# Altium schematic sheet ADC_1_Section.SchDoc
size A4; DocumentNumber: 6; SheetNumber: 6; SheetTotal: 11
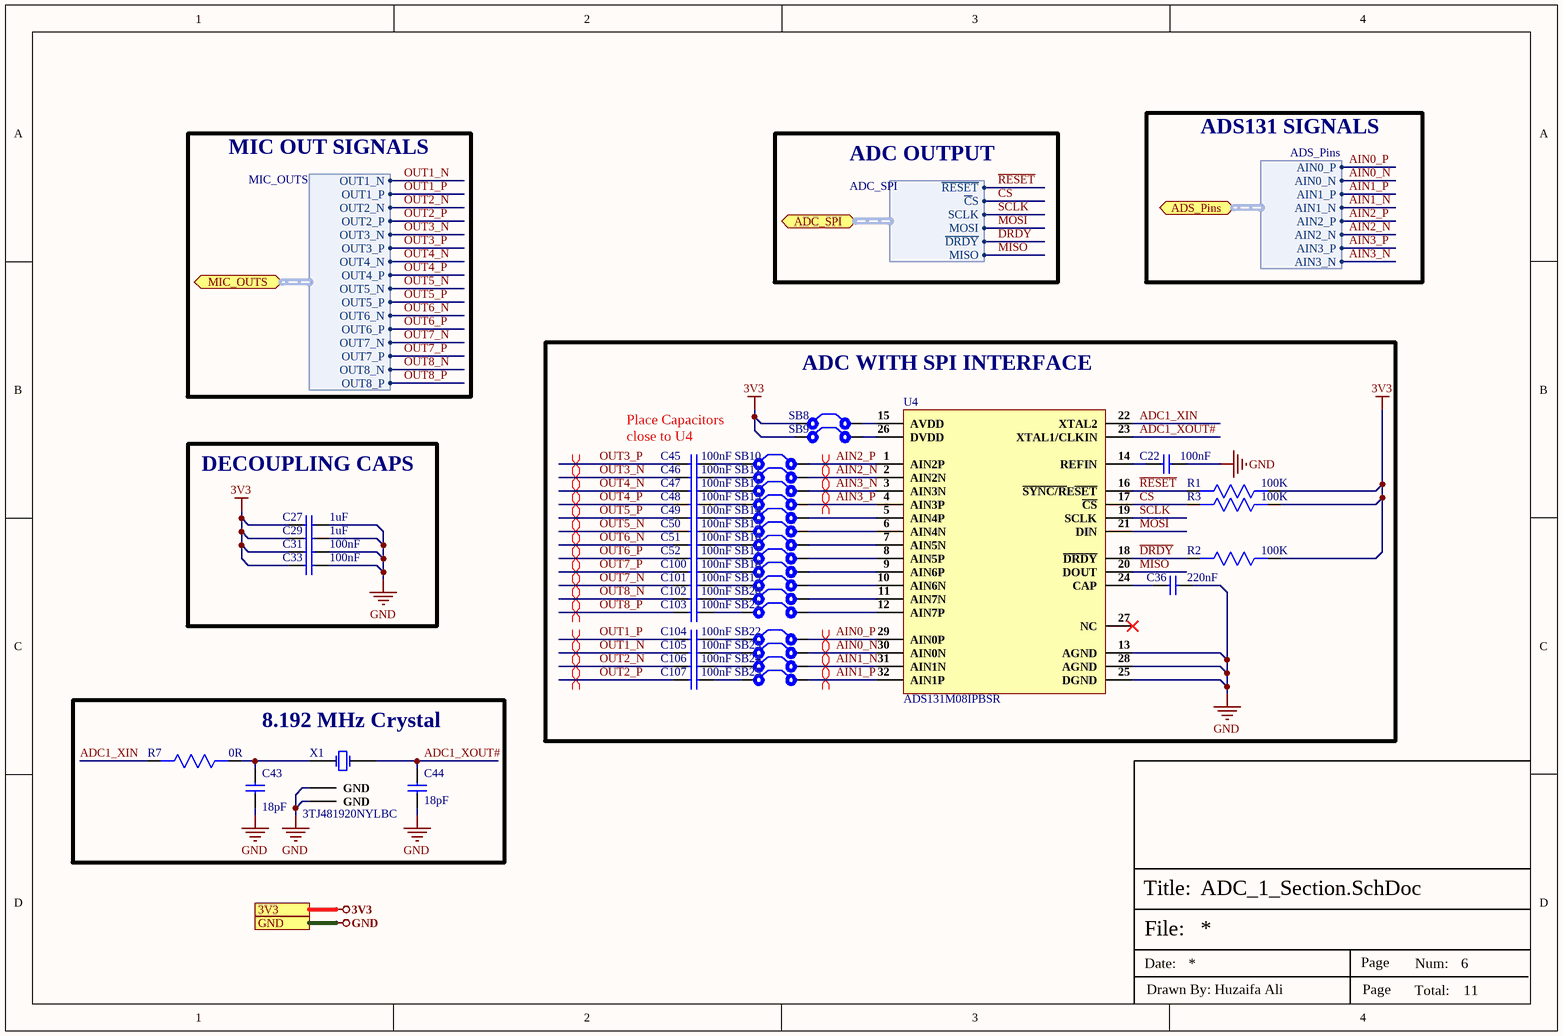
[diagram p0: ADC_1_Section.SchDoc]

## Parts
C22  100nF  [Cap-0603]
C27  1uF  [Cap-0402]
C29  1uF  [Cap-0402]
C31  100nF  [Cap-0603]
C33  100nF  [Cap-0603]
C36  220nF  [Cap 0603]
C43  18pF  [Cap 0603]
C44  18pF  [Cap 0603]
C45  100nF  [Cap-0402]
C46  100nF  [Cap-0402]
C47  100nF  [Cap-0402]
C48  100nF  [Cap-0402]
C49  100nF  [Cap-0402]
C50  100nF  [Cap-0402]
C51  100nF  [Cap-0402]
C52  100nF  [Cap-0402]
C100  100nF  [Cap-0402]
C101  100nF  [Cap-0402]
C102  100nF  [Cap-0402]
C103  100nF  [Cap-0402]
C104  100nF  [Cap-0402]
C105  100nF  [Cap-0402]
C106  100nF  [Cap-0402]
C107  100nF  [Cap-0402]
R1  100K  [Res0603]
R2  100K  [Res0603]
R3  100K  [Res0603]
R7  0R  [Res0603]
SB8  Solder Bridge  [Solder Bridge]  (value not drawn)
SB9  Solder Bridge  [Solder Bridge]  (value not drawn)
SB10  Solder Bridge  [Solder Bridge]  (value not drawn)
SB11  Solder Bridge  [Solder Bridge]  (value not drawn)
SB12  Solder Bridge  [Solder Bridge]  (value not drawn)
SB13  Solder Bridge  [Solder Bridge]  (value not drawn)
SB14  Solder Bridge  [Solder Bridge]  (value not drawn)
SB15  Solder Bridge  [Solder Bridge]  (value not drawn)
SB16  Solder Bridge  [Solder Bridge]  (value not drawn)
SB17  Solder Bridge  [Solder Bridge]  (value not drawn)
SB18  Solder Bridge  [Solder Bridge]  (value not drawn)
SB19  Solder Bridge  [Solder Bridge]  (value not drawn)
SB20  Solder Bridge  [Solder Bridge]  (value not drawn)
SB21  Solder Bridge  [Solder Bridge]  (value not drawn)
SB22  Solder Bridge  [Solder Bridge]  (value not drawn)
SB23  Solder Bridge  [Solder Bridge]  (value not drawn)
SB24  Solder Bridge  [Solder Bridge]  (value not drawn)
SB25  Solder Bridge  [Solder Bridge]  (value not drawn)
U4  ADS131M08IPBSR  [32TQFP]
X1  3TJ481920NYLBC  [3TJ481920NYLBC]

## Blocks framed on the sheet
ADC WITH SPI INTERFACE: C22 C36 C45-C52 C100-C107 R1-R3 SB8-SB25 U4
DECOUPLING CAPS: C27 C29 C31 C33
8.192 MHz Crystal: C43 C44 R7 X1

## Ports
3V3, ADC_SPI (bidir, harness ADC_SPI), ADS_Pins (bidir, harness ADS_Pins), GND, MIC_OUTS (bidir, harness MIC_OUTS)

## Harnesses
MIC_OUTS: OUT1_N, OUT1_P, OUT2_N, OUT2_P, OUT3_N, OUT3_P, OUT4_N, OUT4_P, OUT5_N, OUT5_P, OUT6_N, OUT6_P, OUT7_N, OUT7_P, OUT8_N, OUT8_P
ADC_SPI: ~{RESET}, ~{C}S, SCLK, MOSI, ~{DRDY}, MISO
ADS_Pins: AIN2_P, AIN2_N, AIN3_N, AIN3_P, AIN0_P, AIN0_N, AIN1_N, AIN1_P

## Nets
3V3: C27.1 C29.1 C31.1 C33.1 R1.1 R2.1 R3.1 SB8.1 SB9.1 ; port 3V3
GND: C22.2 C27.2 C29.2 C31.2 C33.2 C36.2 C43.1 C44.1 U4.13(AGND) U4.25(DGND) U4.28(AGND) X1.2(GND) X1.4(GND) ; port GND
~{C}S: R3.2 U4.17(~{CS}) ; port ADC_SPI.~{C}S
~{DRDY}: R2.2 U4.18(~{DRDY}) ; port ADC_SPI.~{DRDY}
~{RESET}: R1.2 U4.16(~{SYNC/R}E~{SET}) ; port ADC_SPI.~{RESET}
ADC1_XIN: R7.2 U4.22(XTAL2)
ADC1_XOUT#: C44.2 U4.23(XTAL1/CLKIN) X1.3(OSC2)
AIN0_N: SB23.2 U4.30(AIN0N) ; port ADS_Pins.AIN0_N
AIN0_P: SB22.2 U4.29(AIN0P) ; port ADS_Pins.AIN0_P
AIN1_N: SB24.2 U4.31(AIN1N) ; port ADS_Pins.AIN1_N
AIN1_P: SB25.2 U4.32(AIN1P) ; port ADS_Pins.AIN1_P
AIN2_N: SB11.2 U4.2(AIN2N) ; port ADS_Pins.AIN2_N
AIN2_P: SB10.2 U4.1(AIN2P) ; port ADS_Pins.AIN2_P
AIN3_N: SB12.2 U4.3(AIN3N) ; port ADS_Pins.AIN3_N
AIN3_P: SB13.2 U4.4(AIN3P) ; port ADS_Pins.AIN3_P
MISO: U4.20(DOUT) ; port ADC_SPI.MISO
MOSI: U4.21(DIN) ; port ADC_SPI.MOSI
OUT1_N: C105.1 ; port MIC_OUTS.OUT1_N
OUT1_P: C104.1 ; port MIC_OUTS.OUT1_P
OUT2_N: C106.1 ; port MIC_OUTS.OUT2_N
OUT2_P: C107.1 ; port MIC_OUTS.OUT2_P
OUT3_N: C46.1 ; port MIC_OUTS.OUT3_N
OUT3_P: C45.1 ; port MIC_OUTS.OUT3_P
OUT4_N: C47.1 ; port MIC_OUTS.OUT4_N
OUT4_P: C48.1 ; port MIC_OUTS.OUT4_P
OUT5_N: C50.1 ; port MIC_OUTS.OUT5_N
OUT5_P: C49.1 ; port MIC_OUTS.OUT5_P
OUT6_N: C51.1 ; port MIC_OUTS.OUT6_N
OUT6_P: C52.1 ; port MIC_OUTS.OUT6_P
OUT7_N: C101.1 ; port MIC_OUTS.OUT7_N
OUT7_P: C100.1 ; port MIC_OUTS.OUT7_P
OUT8_N: C102.1 ; port MIC_OUTS.OUT8_N
OUT8_P: C103.1 ; port MIC_OUTS.OUT8_P
SCLK: U4.19(SCLK) ; port ADC_SPI.SCLK
NetC22_1: C22.1 U4.14(REFIN)
NetC36_1: C36.1 U4.24(CAP)
NetC43_2: C43.2 R7.1 X1.1(OSC1)
NetC45_2: C45.2 SB10.1
NetC46_2: C46.2 SB11.1
NetC47_2: C47.2 SB12.1
NetC48_2: C48.2 SB13.1
NetC49_2: C49.2 SB14.1
NetC50_2: C50.2 SB15.1
NetC51_2: C51.2 SB16.1
NetC52_2: C52.2 SB17.1
NetC100_2: C100.2 SB18.1
NetC101_2: C101.2 SB19.1
NetC102_2: C102.2 SB20.1
NetC103_2: C103.2 SB21.1
NetC104_2: C104.2 SB22.1
NetC105_2: C105.2 SB23.1
NetC106_2: C106.2 SB24.1
NetC107_2: C107.2 SB25.1
NetSB8_2: SB8.2 U4.15(AVDD)
NetSB9_2: SB9.2 U4.26(DVDD)
NetSB14_2: SB14.2 U4.5(AIN4P)
NetSB15_2: SB15.2 U4.6(AIN4N)
NetSB16_2: SB16.2 U4.7(AIN5N)
NetSB17_2: SB17.2 U4.8(AIN5P)
NetSB18_2: SB18.2 U4.9(AIN6P)
NetSB19_2: SB19.2 U4.10(AIN6N)
NetSB20_2: SB20.2 U4.11(AIN7N)
NetSB21_2: SB21.2 U4.12(AIN7P)

Not connected (* = marked no-connect by the designer): U4 27(NC)*

## Layout directives
differential pair; net class OUT1; differential pair class OUT1_Lines: AIN0_N, AIN0_P, AIN1_N, AIN1_P, AIN2_N, AIN2_P, AIN3_N, AIN3_P
differential pair; differential pair class OUT1_Lines; net class OUT1: OUT1_N, OUT1_P
differential pair; differential pair class OUT2_Lines; net class OUT2: OUT2_N, OUT2_P
differential pair; differential pair class OUT3_Lines; net class OUT3: OUT3_N, OUT3_P
differential pair; differential pair class OUT4_Lines; net class OUT4: OUT4_N, OUT4_P
differential pair; differential pair class OUT5_Lines; net class OUT5: OUT5_N, OUT5_P
differential pair; differential pair class OUT6_Lines; net class OUT6: OUT6_N, OUT6_P
differential pair; differential pair class OUT7_Lines; net class OUT7: OUT7_N, OUT7_P
differential pair; differential pair class OUT8_Lines; net class OUT8: OUT8_N, OUT8_P

## Notes on the sheet
- MIC OUT SIGNALS
- ADC OUTPUT
- ADS131 SIGNALS
- Place Capacitors close to U4
- File:
- Title:
- Date:
- Page
- Num:
- Total:
- Drawn By: Huzaifa Ali

## Library data of the parts
C22 C31 C33 = CC0603KRX5R9BB104: CAP CER 0.1UF 50V X5R 0603; Manufacturer: Yageo; Tolerance: 10%; Item Type: Capacitor; Supplier 1: Digi-Key; Manufacturer Part Number: CC0603KRX5R9BB104; RoHS: Yes; Category: Ceramic Capacitors; Stock 1: 152253; Pricing 1: 1=0.10000, 10=0.05200, 50=0.02820, 100=0.02310, 500=0.01648, 1000=0.01294 (USD); Mount: Surface Mount; Case/Package: 0603; Case Code (Imperial): 0603; Case Code (Metric): 1608; Weight: 7.1E-05oz; Min Operating Temperature: -55°C; Max Operating Temperature: 85°C; Capacitance: 100nF; Packaging: Tape and Reel; Voltage Rating: 50V; Dielectric: X5R; Termination: SMD/SMT; Voltage Rating (DC): 50V; Package Quantity: 4000; Length: 0.063inch; Width: 0.031inch; Thickness: 0.035inch; Lead Free: Lead Free; Halogen Free: Halogen Free; ComponentLink1URL: http://www.mouser.com/ds/2/447/Yageo_UPY-GP_NP0_16V-to-50V_9-358835.pdf?src-supplier=Mouser; ComponentLink1Description: http://www.mouser.com/ds/2/447/Yageo_UPY-GP_NP0_16V-to-50V_9-358835.pdf?src-supplier=Mouser; ComponentLink2URL: https://www.yageo.com/upload/media/product/productsearch/datasheet/mlcc/UPY-GPHC_X5R_4V-to-50V_26.pdf?src-supplier=Digi-Key; ComponentLink2Description: https://www.yageo.com/upload/media/product/productsearch/datasheet/mlcc/UPY-GPHC_X5R_4V-to-50V_26.pdf?src-supplier=Digi-Key; ComponentLink3URL: http://www.yageo.com/exep/pages/download/literatures/ProductSelectionGuide%202014_Final_2.pdf?src-supplier=Digi-Key; ComponentLink3Description: http://www.yageo.com/exep/pages/download/literatures/ProductSelectionGuide%202014_Final_2.pdf?src-supplier=Digi-Key; Supplier Part Number 1: 311-4046-1-ND; LCSC Part Number: C110022
C27 C29 = CC0402KRX5R8BB105: CAP CER 1UF 25V X5R 0402; Manufacturer: Yageo; Tolerance: 10%; Supplier 1: Mouser; Manufacturer Part Number: CC0402KRX5R8BB105; RoHS: Yes; Category: Ceramic Capacitors; Stock 1: 91975; Pricing 1: 1=0.30000, 10=0.20400, 50=0.20400, 100=0.11600, 1000=0.07200, 10000=0.05900 (USD); Mount: Surface Mount; Case/Package: 0402; Case Code (Metric): 1005; Case Code (Imperial): 0402; Weight: 2.3E-05oz; Min Operating Temperature: -55°C; Max Operating Temperature: 85°C; Packaging: Tape and Reel; Capacitance: 1uF; Voltage Rating: 25V; Dielectric: X5R; Termination: SMD/SMT; Voltage Rating (DC): 25V; Package Quantity: 10000; Length: 0.039inch; Width: 0.02inch; Thickness: 0.022inch; Lead Free: Lead Free; Halogen Free: Halogen Free; RoHS Compliant: Yes; ComponentLink1URL: http://www.mouser.com/ds/2/447/Yageo_UPY-GP_NP0_16V-to-50V_9-358835.pdf?src-supplier=Mouser; ComponentLink1Description: http://www.mouser.com/ds/2/447/Yageo_UPY-GP_NP0_16V-to-50V_9-358835.pdf?src-supplier=Mouser; ComponentLink2URL: http://www.yageo.com/documents/recent/UPY-GPHC_X5R_4V-to-50V_25.pdf?src-supplier=Digi-Key; ComponentLink2Description: http://www.yageo.com/documents/recent/UPY-GPHC_X5R_4V-to-50V_25.pdf?src-supplier=Digi-Key; ComponentLink3URL: https://4donline.ihs.com/images/VipMasterIC/IC/YAGO/YAGO-S-A0006851646/YAGO-S-A0006851646-1.pdf?hkey=6D3A4C79FDBF58556ACFDE234799DDF0&src-supplier=Newark; ComponentLink3Description: https://4donline.ihs.com/images/VipMasterIC/IC/YAGO/YAGO-S-A0006851646/YAGO-S-A0006851646-1.pdf?hkey=6D3A4C79FDBF58556ACFDE234799DDF0&src-supplier=Newark; Supplier Part Number 1: 603-CC402KRX5R8BB105; LCSC Part Number: C326568
C36 = UMK107C7224KAHTE: CAP CER 0.22UF 50V X7S 0603; Manufacturer: Taiyo Yuden; Tolerance: 10%; Supplier 1: RSComponents; Manufacturer Part Number: UMK107C7224KAHTE; RoHS: Yes; Category: Ceramic Capacitors; Stock 1: 1; Pricing 1: 4000=0.05100, 8000=0.04300 (USD); Mount: Surface Mount; Case/Package: 0603; Min Operating Temperature: -55°C; Max Operating Temperature: 125°C; Packaging: Cut Tape; Capacitance: 220nF; Voltage Rating: 50V; Ratings: AEC-Q200; ComponentLink1URL: http://ds.yuden.co.jp/TYCOMPAS/ut/detail.do?productNo=UMK107C7224KAHTE&fileName=UMK107C7224KAHTE_SS&mode=specSheetDownload&src-supplier=Digi-Key; ComponentLink1Description: http://ds.yuden.co.jp/TYCOMPAS/ut/detail.do?productNo=UMK107C7224KAHTE&fileName=UMK107C7224KAHTE_SS&mode=specSheetDownload&src-supplier=Digi-Key; Supplier Part Number 1: 1843164
C43 C44 = CC0603JRNPO9BN180: CAP SMD 18pF ±5.0% 50V NPO 0603; Manufacturer: Yageo; Tolerance: 5%; Dielectric: C0G; Temperature Coefficient: 30ppm/°C; Insulation Resistance: 100GR; Supplier 1: Newark; Manufacturer Part Number: CC0603JRNPO9BN180; RoHS: Yes; Category: Ceramic Capacitors; Stock 1: 77880; Pricing 1: 1=0.09900, 25=0.08000, 50=0.06900, 100=0.04700, 250=0.03600, 500=0.02800, 1000=0.02300, 2500=0.01900 (USD); Mount: Surface Mount; Case/Package: 0603; Number of Pins: 2; Case Code (Metric): 1608; Case Code (Imperial): 0603; Min Operating Temperature: -55°C; Max Operating Temperature: 125°C; Capacitance: 18pF; Packaging: Tape and Reel; Voltage Rating: 50V; Voltage Rating (DC): 50V; Package Quantity: 1; Termination: SMD/SMT; Resistor Type: Ceramic; Series: CC; Length: 1.6mm; Width: 0.031inch; Height: 0.8mm; Thickness: 0.035inch; Depth: 0.8mm; Radiation Hardening: No; REACH SVHC: No SVHC; Lead Free: Lead Free; RoHS Compliant: Yes; ComponentLink1URL: https://datasheet.ciiva.com/144/mlccorderingcode-144638.pdf?src-supplier=Digi-Key; ComponentLink1Description: https://datasheet.ciiva.com/144/mlccorderingcode-144638.pdf?src-supplier=Digi-Key; ComponentLink2URL: https://datasheet.ciiva.com/144/mlccorderingcode-144637.pdf?src-supplier=Digi-Key; ComponentLink2Description: https://datasheet.ciiva.com/144/mlccorderingcode-144637.pdf?src-supplier=Digi-Key; ComponentLink3URL: https://datasheet.ciiva.com/144/mlccorderingcode-144639.pdf?src-supplier=Digi-Key; ComponentLink3Description: https://datasheet.ciiva.com/144/mlccorderingcode-144639.pdf?src-supplier=Digi-Key; ComponentLink4URL: https://datasheet.ciiva.com/28450/1443161-28450477.pdf?src-supplier=Element14; ComponentLink4Description: https://datasheet.ciiva.com/28450/1443161-28450477.pdf?src-supplier=Element14; ComponentLink5URL: https://datasheet.ciiva.com/46430/1835847-46430152.pdf?src-supplier=Element14; ComponentLink5Description: https://datasheet.ciiva.com/46430/1835847-46430152.pdf?src-supplier=Element14; ComponentLink6URL: https://datasheet.ciiva.com/5425/upy-gp-np0-16v-to-50v-8-5425439.pdf?src-supplier=Mouser; ComponentLink6Description: https://datasheet.ciiva.com/5425/upy-gp-np0-16v-to-50v-8-5425439.pdf?src-supplier=Mouser; ComponentLink7URL: https://datasheet.ciiva.com/8033/1734582-8033733.pdf?src-supplier=Element14; ComponentLink7Description: https://datasheet.ciiva.com/8033/1734582-8033733.pdf?src-supplier=Element14; ComponentLink8URL: https://datasheet.ciiva.com/11587/upy-gp-np0-16v-to-50v-8-11587323.pdf?src-supplier=Avnet; ComponentLink8Description: https://datasheet.ciiva.com/11587/upy-gp-np0-16v-to-50v-8-11587323.pdf?src-supplier=Avnet; Supplier Part Number 1: 68R4719
C45-C52 C100-C107 = CC0402KRX5R7BB104: CAP CER 0.1UF 16V X5R 0402; Manufacturer: Yageo; Tolerance: 10%; Supplier 1: Mouser; Manufacturer Part Number: CC0402KRX5R7BB104; RoHS: Yes; Category: Ceramic Capacitors; Stock 1: 936792; Pricing 1: 1=0.10000, 10=0.02300, 50=0.02300, 100=0.01100, 1000=0.00600, 10000=0.00400 (USD); Mount: Surface Mount; Case/Package: 0402; Number of Pins: 2; Case Code (Metric): 1005; Case Code (Imperial): 0402; Min Operating Temperature: -55°C; Max Operating Temperature: 85°C; Capacitance: 100nF; Dielectric: X5R; Packaging: Tape and Reel; Voltage Rating: 16V; Package Quantity: 1; Voltage Rating (DC): 16V; Termination: SMD/SMT; Resistor Type: Ceramic; Series: CC; Construction: Flat; Length: 1mm; Width: 0.02inch; Height: 0.5mm; Thickness: 0.022inch; Depth: 0.5mm; Radiation Hardening: No; REACH SVHC: Unknown; Lead Free: Lead Free; Halogen Free: Halogen Free; RoHS Compliant: Yes; ComponentLink1URL: https://datasheet.ciiva.com/155/mlccorderingcode-155879.pdf?src-supplier=Digi-Key; ComponentLink1Description: https://datasheet.ciiva.com/155/mlccorderingcode-155879.pdf?src-supplier=Digi-Key; ComponentLink2URL: https://datasheet.ciiva.com/155/mlccorderingcode-155878.pdf?src-supplier=Digi-Key; ComponentLink2Description: https://datasheet.ciiva.com/155/mlccorderingcode-155878.pdf?src-supplier=Digi-Key; ComponentLink3URL: https://datasheet.ciiva.com/155/mlccorderingcode-155880.pdf?src-supplier=Digi-Key; ComponentLink3Description: https://datasheet.ciiva.com/155/mlccorderingcode-155880.pdf?src-supplier=Digi-Key; ComponentLink4URL: https://datasheet.ciiva.com/11464/upy-gphc-x5r-4v-to-50v-12-11464869.pdf?src-supplier=Avnet; ComponentLink4Description: https://datasheet.ciiva.com/11464/upy-gphc-x5r-4v-to-50v-12-11464869.pdf?src-supplier=Avnet; Supplier Part Number 1: 603-CC402KRX5R7BB104; LCSC Part Number: C106204
R1-R3 = CRGH0603J100K: RES SMD 100K OHM 5% 1/5W 0603; Manufacturer: TE Connectivity; Resistance: 100kR; Temperature Coefficient: 100ppm/°C; Power Rating: 200mW; Voltage Rating: 50V; Number of Resistors: 1; Supplier 1: Digi-Key; Manufacturer Part Number: CRGH0603J100K; Stock 1: 23277; Pricing 1: 1=0.1, 10=0.049, 100=0.02, 1000=0.00899, 2500=0.0078 (USD); Mount: Surface Mount; Case/Package: 0603; Case Code (Imperial): 0603; Case Code (Metric): 1608; Min Operating Temperature: -55°C; Max Operating Temperature: 125°C; Tolerance: 5%; Packaging: Tape and Reel; Resistor Type: Thick Film,Power resistor; Number of Terminations: 2; Series: CRGH; Termination: Solder; Voltage Rating (DC): 50V; Resistance Tolerance: 5%; Technology: THICK FILM; Length: 1.6mm; Width: 0.8mm; Height: 0.45mm; Depth: 0.8mm; RoHS Compliant: Yes; REACH SVHC: No SVHC; ELV: Compliant; ComponentLink1URL: http://www.farnell.com/datasheets/2007183.pdf?src-supplier=Element14; ComponentLink1Description: http://www.farnell.com/datasheets/2007183.pdf?src-supplier=Element14; Supplier Part Number 1: A126393DKR-ND
R7 = RC0603FR-070RL: RES SMD 0R, 1%, 0.1W, 0603; Manufacturer: Yageo; Resistance: 0mR; Power Rating: 100mW; Voltage Rating (DC): 50V; Temperature Coefficient: 200ppm/°C; Current Rating: 1A; Working Voltage: 75V; Supplier 1: Arrow Electronics; Manufacturer Part Number: RC0603FR-070RL; RoHS: Yes; Category: Chip SMD Resistors; Stock 1: 1270000; Pricing 1: 5000=0.00320, 5000=0.00490, 50000=0.00450, 500000=0.00250, 2500000=0.00150 (USD); Case/Package: 0603; Number of Pins: 2; Contact Plating: Tin,Matte; Case Code (Metric): 1608; Case Code (Imperial): 0603; Min Operating Temperature: -55°C; Max Operating Temperature: 155°C; Resistor Type: Thick Film; Packaging: Tape and Reel; Tolerance: 1%; Package Quantity: 5000; Voltage Rating: 50V; Number of Terminations: 2; Termination: SMD/SMT; Max Power Dissipation: 100mW; Features: Moisture Resistant; Length: 1.6mm; Width: 0.031inch; Height: 0.45mm; Depth: 0.8mm; Radiation Hardening: No; REACH SVHC: No SVHC; Lead Free: Lead Free; Military Standard: Not; ComponentLink1URL: https://datasheet.ciiva.com/11808/0900766b80f96399-11808172.pdf?src-supplier=RSComponents; ComponentLink1Description: https://datasheet.ciiva.com/11808/0900766b80f96399-11808172.pdf?src-supplier=RSComponents; ComponentLink2URL: https://datasheet.ciiva.com/5558/rc0603-272842-5558341.pdf?src-supplier=Mouser; ComponentLink2Description: https://datasheet.ciiva.com/5558/rc0603-272842-5558341.pdf?src-supplier=Mouser; ComponentLink3URL: https://datasheet.ciiva.com/46382/443971-46382072.pdf?src-supplier=Element14; ComponentLink3Description: https://datasheet.ciiva.com/46382/443971-46382072.pdf?src-supplier=Element14; ComponentLink4URL: https://datasheet.ciiva.com/29721/pyu-r-int-thick-7-29721178.pdf?src-supplier=Digi-Key; ComponentLink4Description: https://datasheet.ciiva.com/29721/pyu-r-int-thick-7-29721178.pdf?src-supplier=Digi-Key; ComponentLink5URL: https://datasheet.ciiva.com/5684/443971-5684699.pdf?src-supplier=Farnell; ComponentLink5Description: https://datasheet.ciiva.com/5684/443971-5684699.pdf?src-supplier=Farnell; ComponentLink6URL: https://datasheet.ciiva.com/7983/443971-7983627.pdf?src-supplier=Element14; ComponentLink6Description: https://datasheet.ciiva.com/7983/443971-7983627.pdf?src-supplier=Element14; ComponentLink7URL: https://datasheet.ciiva.com/29721/pyu-rc0603-51-rohs-l-4-29721179.pdf?src-supplier=Digi-Key; ComponentLink7Description: https://datasheet.ciiva.com/29721/pyu-rc0603-51-rohs-l-4-29721179.pdf?src-supplier=Digi-Key; ComponentLink8URL: https://datasheet.ciiva.com/22643/1868787-22643388.pdf?src-supplier=Element14; ComponentLink8Description: https://datasheet.ciiva.com/22643/1868787-22643388.pdf?src-supplier=Element14; Supplier Part Number 1: RC0603FR-070RL
SB8-SB25 = Solder Bridge: Solder Bridge ON
U4 = ADS131M08IPBSR: IC ADC 24BIT SIGMA-DELTA 32TQFP; Manufacturer: Texas Instruments; Supplier 1: Mouser; Manufacturer Part Number: ADS131M08IPBSR; RoHS: Yes; Category: Analog to Digital Converters (ADCs); Pricing 1: 1=8.85000, 10=7.99000, 50=7.62000, 100=6.62000, 1000=5.39000, 10000=5.39000 (USD); Supplier Part Number 1: 595-ADS131M08IPBSR
X1 = 3TJ481920NYLBC: 8.192MHz SMD Crystal Resonator 12pF 150Ω ±10ppm ±30ppm -40℃~+85℃ SMD_3225_4P Crystals ROHS; Manufacturer: JYJE; Manufacturer Part No: 3TJ481920NYLBC; Package: Custom